# Altium project DAL_BRW_HW.PrjPcb
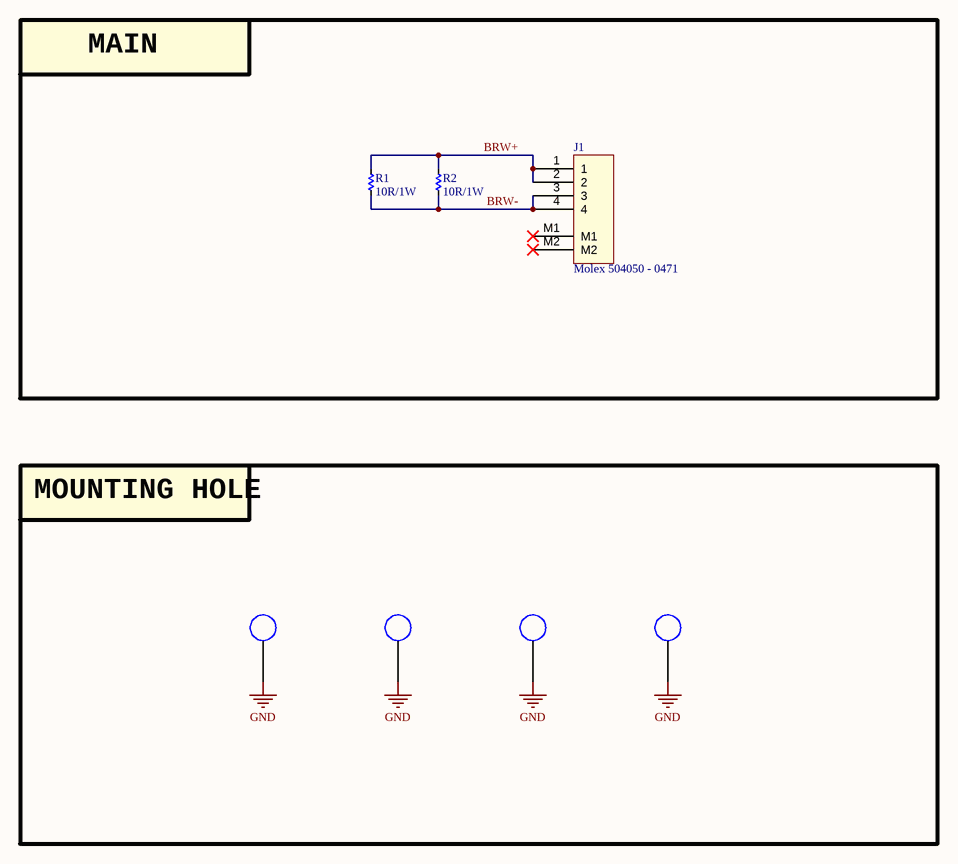
[diagram p0: Sheet1.SchDoc]
1 sheet, 7 parts. Net scope: global (net labels, ports and power ports of the same name join across sheets).
Board file: PCB1.PcbDoc

## Sheet Sheet1.SchDoc
size 420 x 297 mm; SheetNumber: 1; SheetTotal: 1

### Parts
H1  M3  [M3_1]  (value not drawn)
H2  M3  [M3_1]  (value not drawn)
H3  M3  [M3_1]  (value not drawn)
H4  M3  [M3_1]  (value not drawn)
J1  Molex 504050 - 0471  [MOLEX_5040500491]
R1  10R/1W  [RES_1000JA100_VIS]
R2  10R/1W  [RES_1000JA100_VIS]

### Blocks framed on the sheet
MAIN: J1 R1 R2
MOUNTING HOLE: H1-H4

### Nets
GND: H1.1 H2.1 H3.1 H4.1
BRW+: J1.1 J1.2 R1.1 R2.1
BRW-: J1.3 J1.4 R1.2 R2.2

Not connected (* = marked no-connect by the designer): J1 M1* M2*

### Notes on the sheet
- Project
- Sub-system:
- Design by:
- Sheet title:
- Sheet:
- of
- Checked by:
- Approved by:
- Doc no:
- Revision
- Size:
- Date:

### Library data of the parts
J1 = Header 4x1_2M
R1 R2 = Res: Manufacturer: Generic Components; Class: Passive; SubClass: R; Published: 08/06/2000; Publisher: Altium Hobart Technology Centre